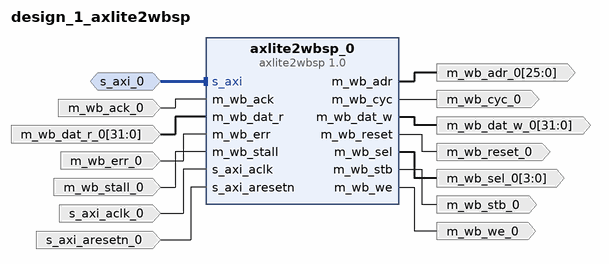
[diagram p0: block diagram of the top level]
# Vivado block design design_1_axlite2wbsp, xc7a100tcsg324-1, Vivado 2024.2
create_bd_design design_1_axlite2wbsp

create_bd_intf_port -mode Slave -vlnv xilinx.com:interface:aximm_rtl:1.0 s_axi_0
set_property -dict [list \
  CONFIG.ADDR_WIDTH 28 \
  CONFIG.ARUSER_WIDTH 0 \
  CONFIG.AWUSER_WIDTH 0 \
  CONFIG.BUSER_WIDTH 0 \
  CONFIG.DATA_WIDTH 32 \
  CONFIG.HAS_BRESP 1 \
  CONFIG.HAS_BURST 0 \
  CONFIG.HAS_CACHE 1 \
  CONFIG.HAS_LOCK 0 \
  CONFIG.HAS_PROT 1 \
  CONFIG.HAS_QOS 0 \
  CONFIG.HAS_REGION 0 \
  CONFIG.HAS_RRESP 1 \
  CONFIG.HAS_WSTRB 1 \
  CONFIG.ID_WIDTH 0 \
  CONFIG.NUM_READ_OUTSTANDING 1 \
  CONFIG.NUM_READ_THREADS 1 \
  CONFIG.NUM_WRITE_OUTSTANDING 1 \
  CONFIG.NUM_WRITE_THREADS 1 \
  CONFIG.PROTOCOL AXI4LITE \
  CONFIG.READ_WRITE_MODE READ_WRITE \
  CONFIG.RUSER_BITS_PER_BYTE 0 \
  CONFIG.RUSER_WIDTH 0 \
  CONFIG.WUSER_BITS_PER_BYTE 0 \
  CONFIG.WUSER_WIDTH 0 \
] [get_bd_intf_ports s_axi_0]
create_bd_port -dir I -type clk s_axi_aclk_0
set_property -dict {CONFIG.FREQ_TOLERANCE_HZ -1} [get_bd_ports s_axi_aclk_0]
create_bd_port -dir I -type rst s_axi_aresetn_0
create_bd_port -dir O -type rst m_wb_reset_0
create_bd_port -dir O m_wb_cyc_0
create_bd_port -dir O m_wb_stb_0
create_bd_port -dir O m_wb_we_0
create_bd_port -dir O -from 25 -to 0 m_wb_adr_0
create_bd_port -dir O -from 31 -to 0 m_wb_dat_w_0
create_bd_port -dir O -from 3 -to 0 m_wb_sel_0
create_bd_port -dir I m_wb_ack_0
create_bd_port -dir I -from 31 -to 0 m_wb_dat_r_0
create_bd_port -dir I m_wb_stall_0
create_bd_port -dir I m_wb_err_0

create_bd_cell -type ip -vlnv user.org:user:axlite2wbsp:1.0 axlite2wbsp_0

# ---- connections ----

connect_bd_intf_net -intf_net s_axi_0_1 [get_bd_intf_ports s_axi_0] [get_bd_intf_pins axlite2wbsp_0/s_axi]
connect_bd_net [get_bd_pins axlite2wbsp_0/m_wb_adr] [get_bd_ports m_wb_adr_0]
connect_bd_net [get_bd_pins axlite2wbsp_0/m_wb_cyc] [get_bd_ports m_wb_cyc_0]
connect_bd_net [get_bd_pins axlite2wbsp_0/m_wb_dat_w] [get_bd_ports m_wb_dat_w_0]
connect_bd_net [get_bd_pins axlite2wbsp_0/m_wb_reset] [get_bd_ports m_wb_reset_0]
connect_bd_net [get_bd_pins axlite2wbsp_0/m_wb_sel] [get_bd_ports m_wb_sel_0]
connect_bd_net [get_bd_pins axlite2wbsp_0/m_wb_stb] [get_bd_ports m_wb_stb_0]
connect_bd_net [get_bd_pins axlite2wbsp_0/m_wb_we] [get_bd_ports m_wb_we_0]
connect_bd_net -net m_wb_ack_0_1 [get_bd_ports m_wb_ack_0] [get_bd_pins axlite2wbsp_0/m_wb_ack]
connect_bd_net -net m_wb_dat_r_0_1 [get_bd_ports m_wb_dat_r_0] [get_bd_pins axlite2wbsp_0/m_wb_dat_r]
connect_bd_net -net m_wb_err_0_1 [get_bd_ports m_wb_err_0] [get_bd_pins axlite2wbsp_0/m_wb_err]
connect_bd_net -net m_wb_stall_0_1 [get_bd_ports m_wb_stall_0] [get_bd_pins axlite2wbsp_0/m_wb_stall]
connect_bd_net -net s_axi_aclk_0_1 [get_bd_ports s_axi_aclk_0] [get_bd_pins axlite2wbsp_0/s_axi_aclk]
connect_bd_net -net s_axi_aresetn_0_1 [get_bd_ports s_axi_aresetn_0] [get_bd_pins axlite2wbsp_0/s_axi_aresetn]

validate_bd_design
save_bd_design
